# Altium project Control.PrjPcb
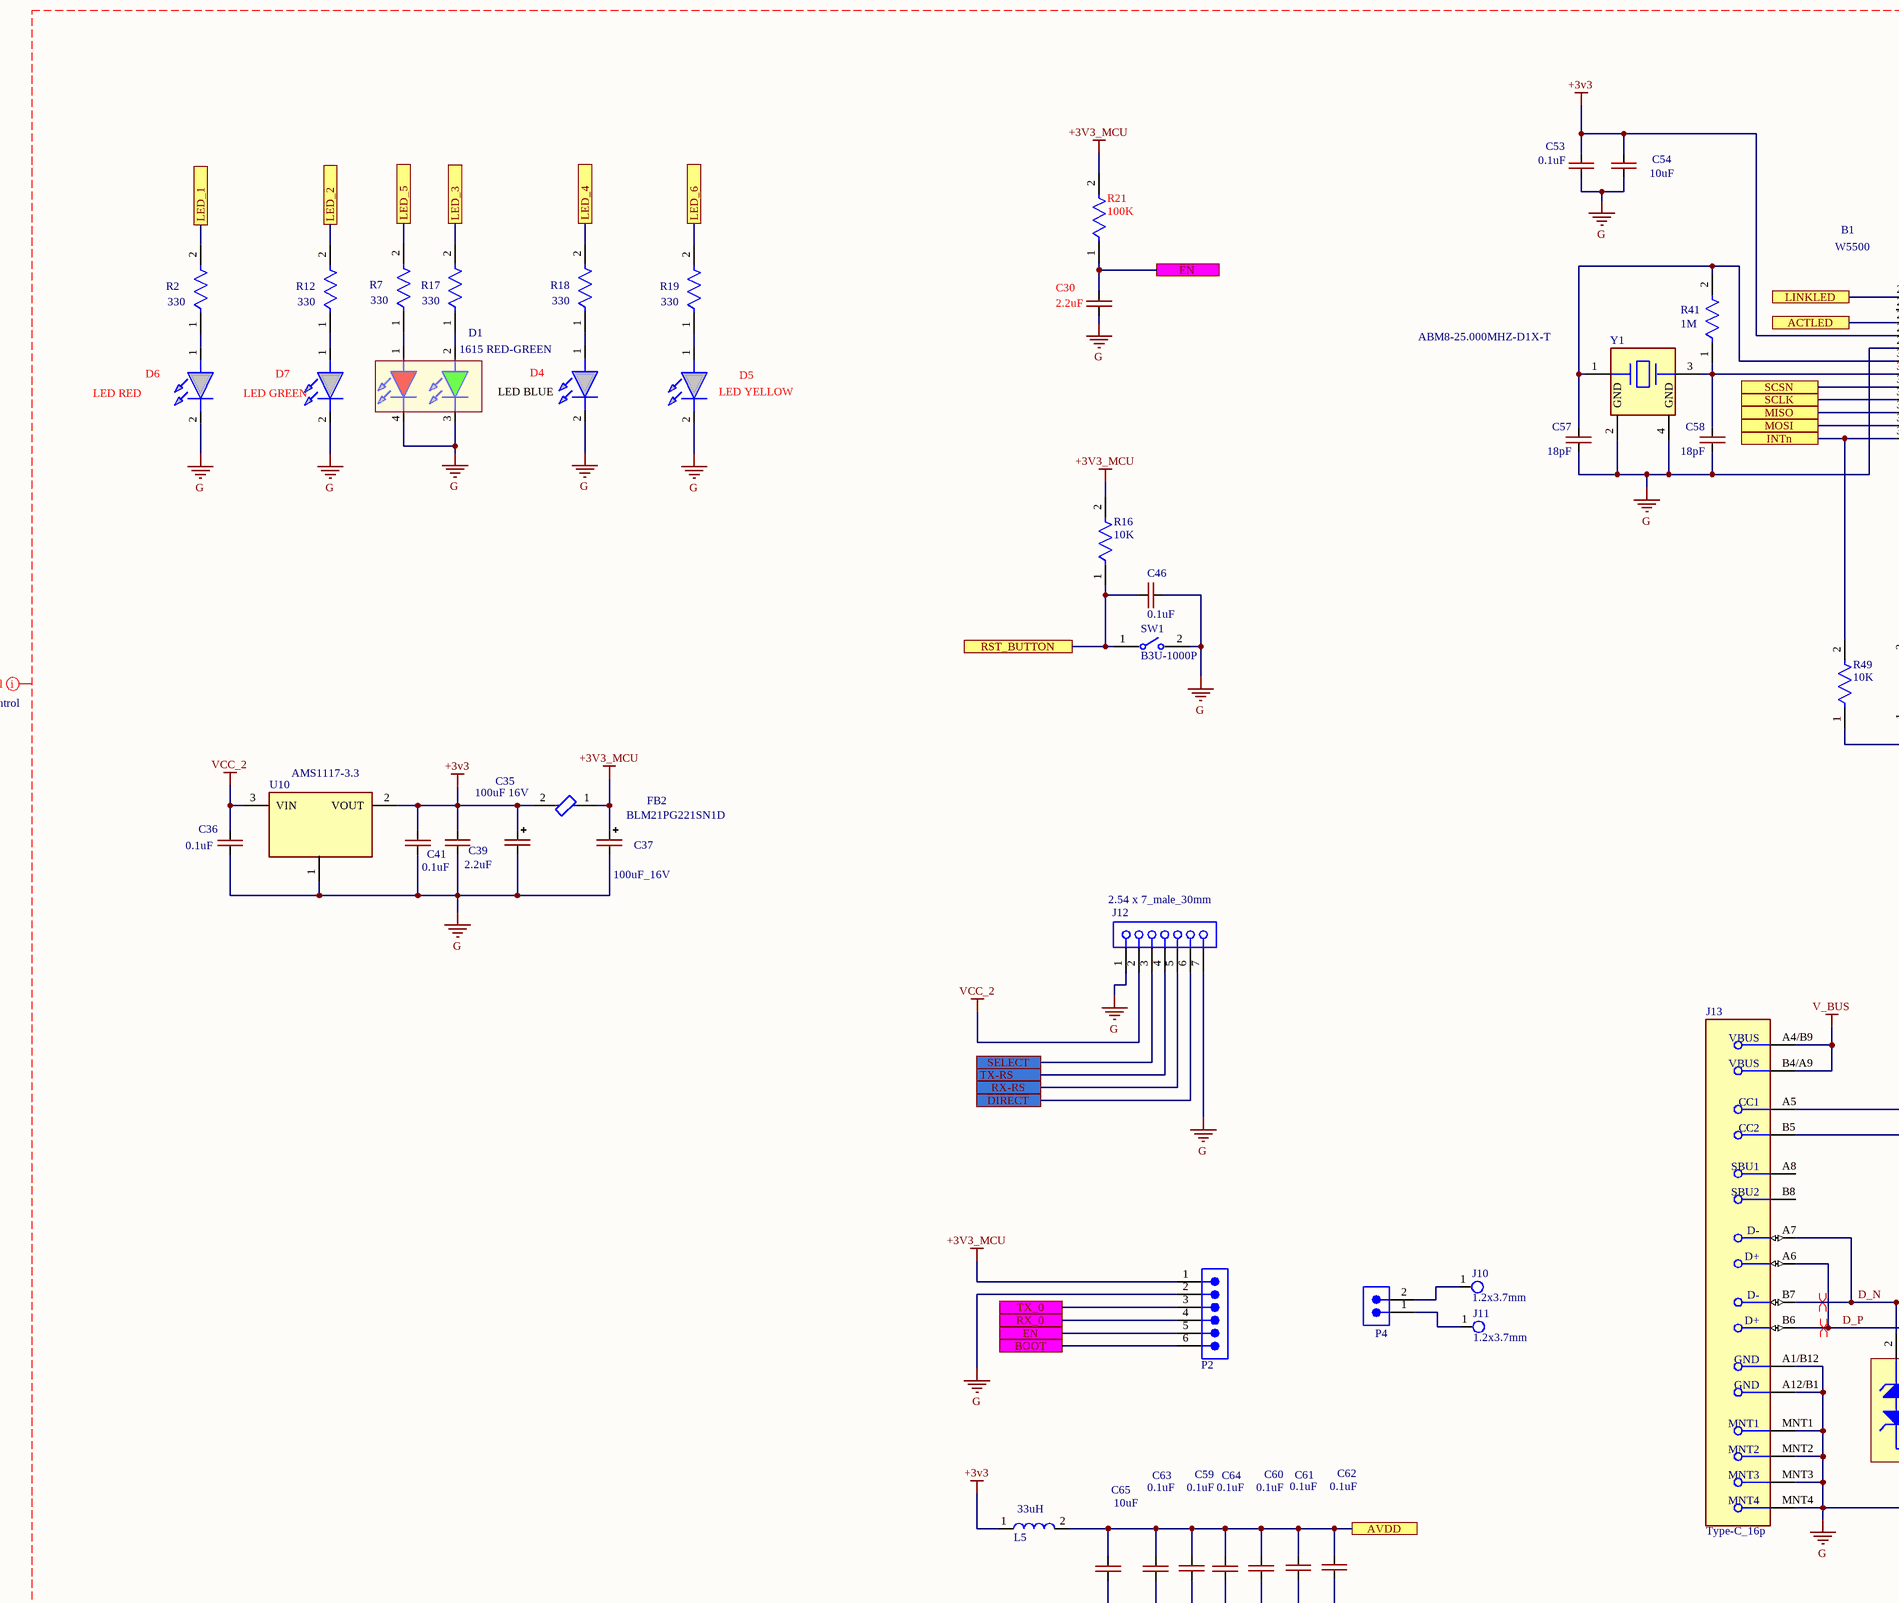
[diagram p0: Control.SchDoc, top left]
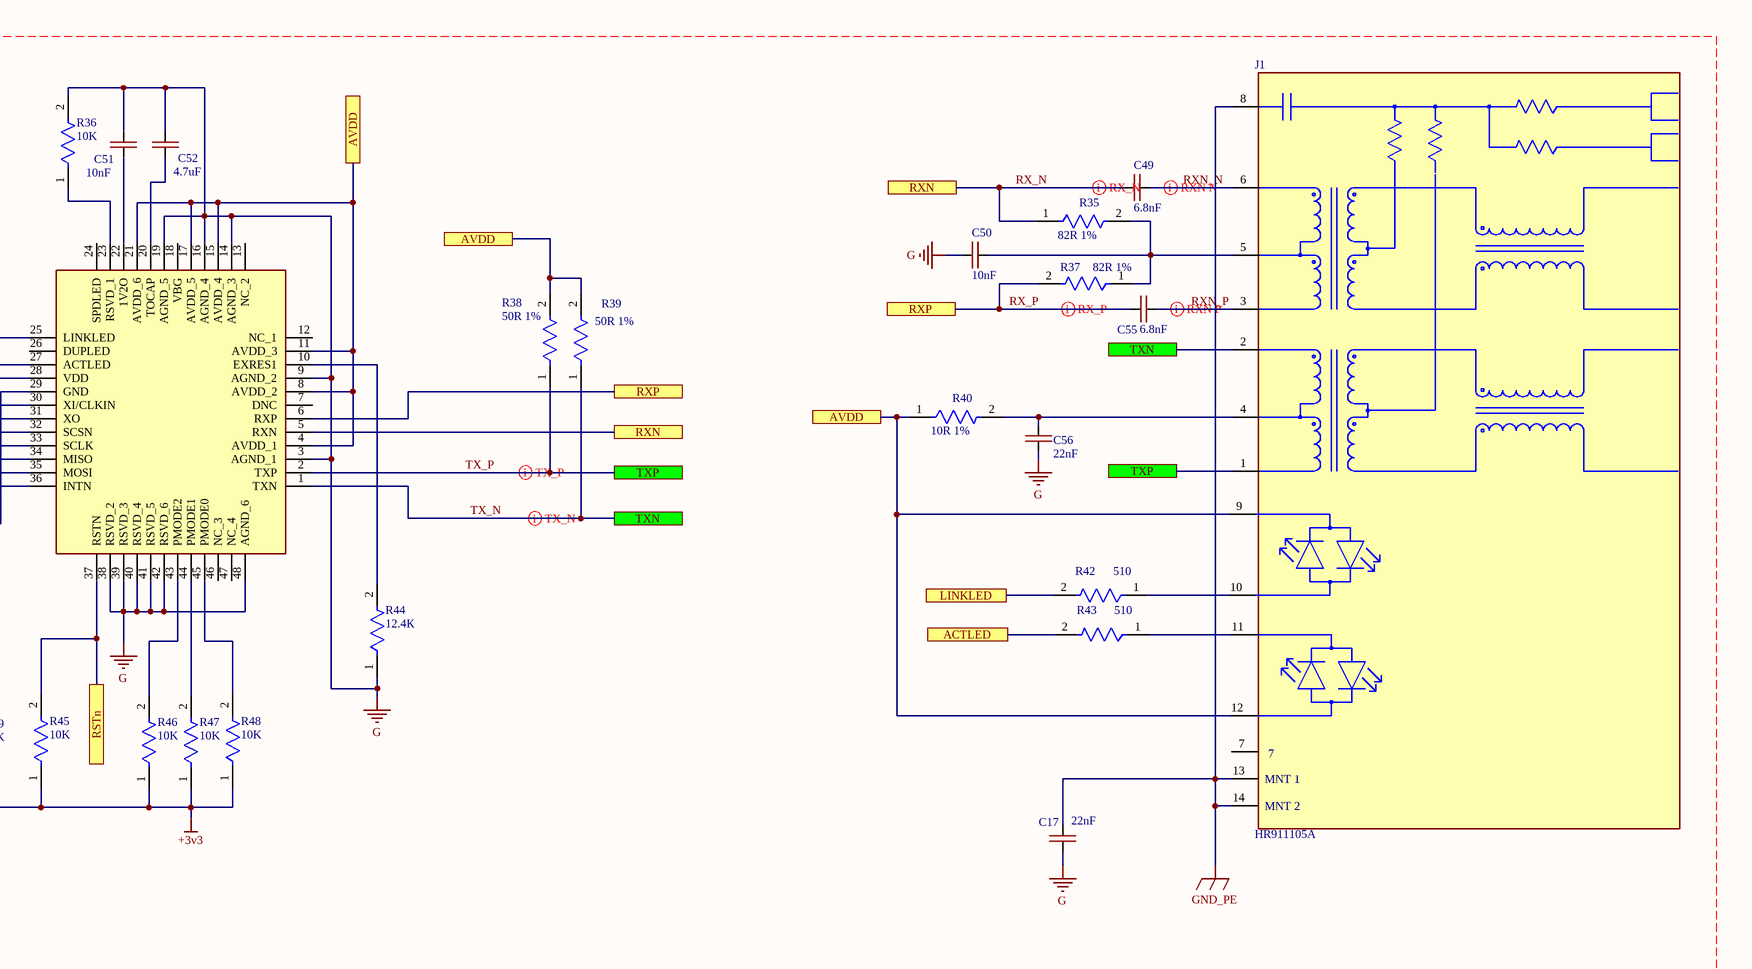
[diagram p1: Control.SchDoc, top right]
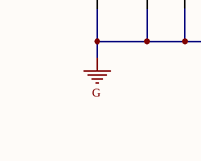
[diagram p2: Control.SchDoc, bottom left]
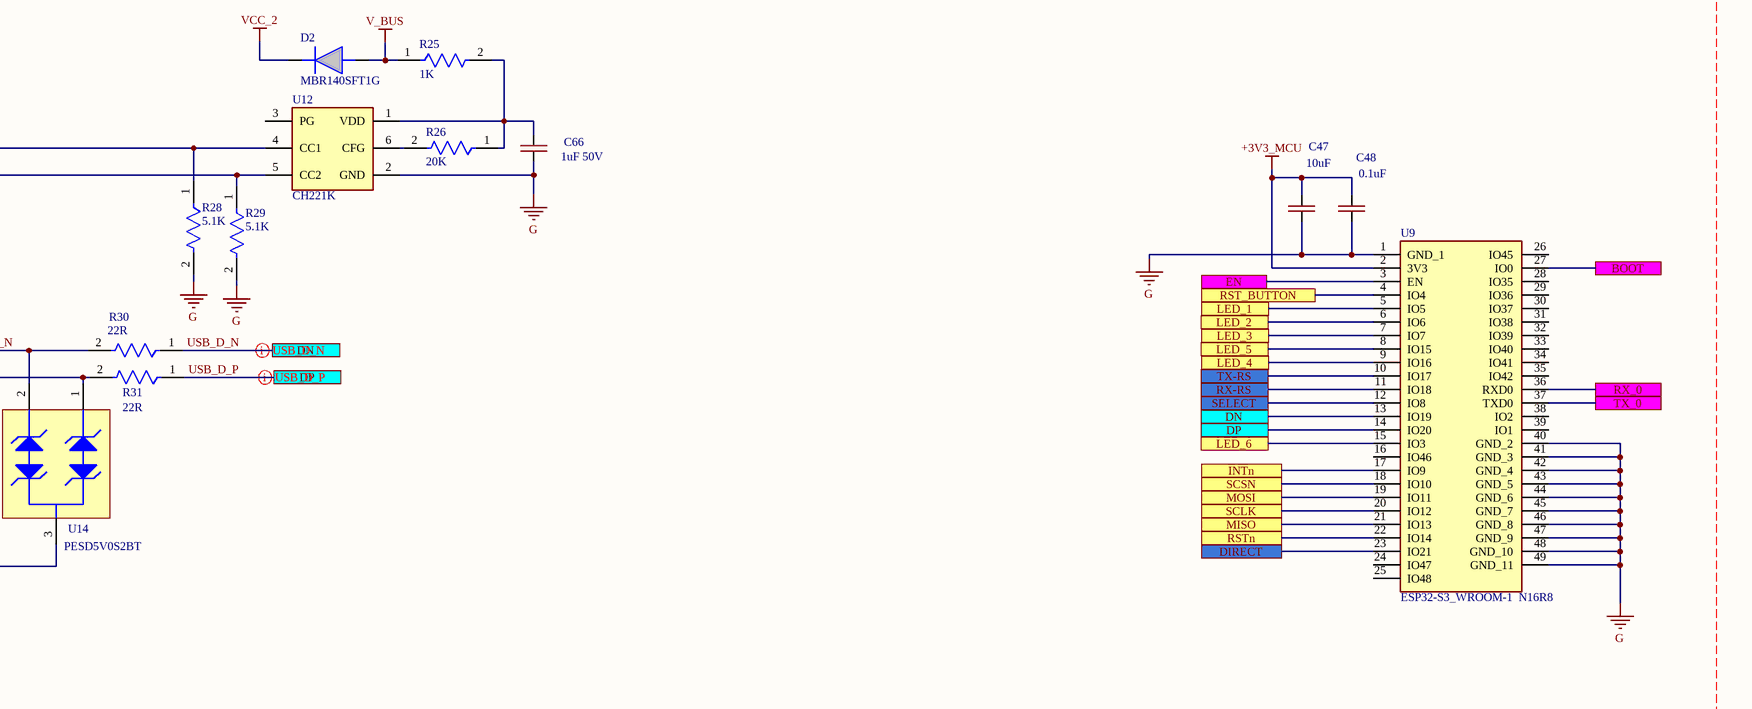
[diagram p3: Control.SchDoc, bottom right]
1 sheet, 79 parts. Net scope: flat (ports and power ports of the same name join across sheets).
Board file: Control.PcbDoc

## Sheet Control.SchDoc
size A1; SheetNumber: 1; SheetTotal: 1; SPICEModelCacheNLVBOJOE: <root> / <DocumentId>NLVBOJOE</DocumentId> / </root>

### Parts
B1  W5500  [QFP50P900X900X160-48N]
C17  22nF  [CAP-0603]
C30  2.2uF  [CAP-0603]
C35  100uF 16V  [CAP-TAN-C]
C36  0.1uF  [CAP-0603]
C37  100uF_16V  [CAP-TAN-C]
C39  2.2uF  [CAP-0603]
C41  0.1uF  [CAP-0603]
C46  0.1uF  [CAP-0603]
C47  10uF  [CAP-0805]
C48  0.1uF  [CAP-0805]
C49  6.8nF  [CAP-0402]
C50  10nF  [CAP-0402]
C51  10nF  [CAP-0603]
C52  4.7uF  [CAP-0603]
C53  0.1uF  [CAP-0603]
C54  10uF  [CAP-0805]
C55  6.8nF  [CAP-0402]
C56  22nF  [CAP-0402]
C57  18pF  [CAP-0402]
C58  18pF  [CAP-0402]
C59  0.1uF  [CAP-0603]
C60  0.1uF  [CAP-0603]
C61  0.1uF  [CAP-0603]
C62  0.1uF  [CAP-0603]
C63  0.1uF  [CAP-0603]
C64  0.1uF  [CAP-0603]
C65  10uF  [CAP-0603]
C66  1uF 50V  [CAP-0805]
D1  1615 RED-GREEN  [LED_Bicolor_1615]
D2  MBR140SFT1G  [SODFL3616X98N]
D4  LED BLUE  [LED_BLUE]
D5  LED YELLOW  [LED_YELLOW]
D6  LED RED  [LED_RED]
D7  LED GREEN  [LED_GREEN]
FB2  BLM21PG221SN1D  [FP-BLM21-0_2-t0_85-e0_5-IPC_A]
J1  HR911105A  [RJ-45]
J10  1.2x3.7mm  [Pad_conn_1.2x3.7mm]
J11  1.2x3.7mm  [Pad_conn_1.2x3.7mm]
J12  2.54 x 7_male_30mm  [2.54_Connector_x7_male_30mm]
J13  Type-C_16p  [Type-C 16p vertical]
L5  33uH  [Coil_4.5x4.5_mm]
P2  61300611121  [61300611121]  (value not drawn)
P4  691305540002  [691305540002]  (value not drawn)
R2  330  [RES-0402]
R7  330  [RES-0402]
R12  330  [RES-0402]
R16  10K  [RES-0402]
R17  330  [RES-0402]
R18  330  [RES-0402]
R19  330  [RES-0402]
R21  100K  [RES-0402]
R25  1K  [RES-0402]
R26  20K  [RES-0402]
R28  5.1K  [RES-0402]
R29  5.1K  [RES-0402]
R30  22R  [RES-0402]
R31  22R  [RES-0402]
R35  82R 1%  [RES-0402]
R36  10K  [RES-0603]
R37  82R 1%  [RES-0402]
R38  50R 1%  [RES-0402]
R39  50R 1%  [RES-0402]
R40  10R 1%  [RES-0402]
R41  1M  [RES-0402]
R42  510  [RES-0402]
R43  510  [RES-0402]
R44  12.4К  [RES-0402]
R45  10K  [RES-0603]
R46  10K  [RES-0603]
R47  10K  [RES-0603]
R48  10K  [RES-0603]
R49  10K  [RES-0603]
SW1  B3U-1000P  [FP-B3U-1000P-B-MFG]
U9  ESP32-S3_WROOM-1  N16R8  [ESP32S3WROOM1N16R8]
U10  AMS1117-3.3  [SOT-89]
U12  CH221K  [SOT-23-6]
U14  PESD5V0S2BT  [PRKT-SOT23-3_V]
Y1  ABM8-25.000MHZ-D1X-T  [FP-ABM8]

### Ports
ACTLED, AVDD, BOOT, DIRECT, DN, DP, EN, INTn, LED_1, LED_2, LED_3, LED_4, LED_5, LED_6, LINKLED, MISO, MOSI, RST_BUTTON, RSTn, RX-RS, RX_0, RXN, RXP, SCLK, SCSN, SELECT, TX-RS, TX_0, TXN, TXP

### Nets
+3v3: B1.28(VDD) C35.1(+) C39.2 C41.2 C53.2 C54.2 FB2.2 L5.1 R45.1 R46.1 R47.1 R48.1 R49.1 U10.2(VOUT)
+3V3_MCU: C37.1(+) C47.2 C48.2 FB2.1 P2.1 R16.2 R21.2 U9.2(3V3)
G: B1.3(AGND_1) B1.9(AGND_2) B1.14(AGND_3) B1.16(AGND_4) B1.19(AGND_5) B1.29(GND) B1.38(RSVD_2) B1.39(RSVD_3) B1.40(RSVD_4) B1.41(RSVD_5) B1.42(RSVD_6) B1.48(AGND_6) C17.1 C30.1 C35.2(-) C36.1 C37.2(-) C39.1 C41.1 C46.1 C47.1 C48.1 C50.1 C51.2 C52.2 C53.1 C54.1 C56.1 C57.1 C58.1 C59.1 C60.1 C61.1 C62.1 C63.1 C64.1 C65.1 C66.1 D1.3(K) D1.4(K) D4.2(K) D5.2(K) D6.2(K) D7.2(K) J12.1 J12.7 J13.A1/B12(GND) J13.A12/B1(GND) J13.MNT1 J13.MNT2 J13.MNT3 J13.MNT4 P2.2 R28.2 R29.2 R36.2 R44.1 SW1.2 U9.1(GND_1) U9.40(GND_2) U9.41(GND_3) U9.42(GND_4) U9.43(GND_5) U9.44(GND_6) U9.45(GND_7) U9.46(GND_8) U9.47(GND_9) U9.48(GND_10) U9.49(GND_11) U10.1(Ground) U12.2(GND) U14.3 Y1.2(GND) Y1.4(GND)
GND_PE: C17.2 J1.8 J1.13(MNT_1) J1.14(MNT_2)
V_BUS: D2.2(A) J13.A4/B9 J13.B4/A9 R25.1
VCC_2: C36.2 D2.1(K) J12.2 U10.3(VIN)
D_N: J13.A7(D-) J13.B7(D-) R30.2 U14.2
D_P: J13.A6(D+) J13.B6(D+) R31.2 U14.1
RX_N: B1.5(RXN) C49.2 R35.1 ; port RXN
RX_P: B1.6(RXP) C55.2 R37.2 ; port RXP
RXN_N: C49.1 J1.6
RXN_P: C55.1 J1.3
TX_N: B1.1(TXN) J1.2 R39.1 ; port TXN
TX_P: B1.2(TXP) J1.1 R38.1 ; port TXP
USB_D_N: R30.1 U9.13(IO19) ; port DN
USB_D_P: R31.1 U9.14(IO20) ; port DP
NetB1_4: B1.4(AVDD_1) B1.8(AVDD_2) B1.11(AVDD_3) B1.15(AVDD_4) B1.17(AVDD_5) B1.21(AVDD_6) C59.2 C60.2 C61.2 C62.2 C63.2 C64.2 C65.2 J1.9(2_ANODE_YELLOW/CATHODE_GREEN) J1.12(2_CATHODE_YELLOW/ANODE_GREEN) L5.2 R38.2 R39.2 R40.1 ; port AVDD
NetB1_10: B1.10(EXRES1) R44.2
NetB1_20: B1.20(TOCAP) C52.1
NetB1_22: B1.22(1V2O) C51.1
NetB1_23: B1.23(RSVD_1) R36.1
NetB1_25: B1.25(LINKLED) R42.2 ; port LINKLED
NetB1_27: B1.27(ACTLED) R43.2 ; port ACTLED
NetB1_30: B1.30(XI/CLKIN) C57.2 R41.2 Y1.1
NetB1_31: B1.31(XO) C58.2 R41.1 Y1.3
NetB1_32: B1.32(SCSN) U9.18(IO10) ; port SCSN
NetB1_33: B1.33(SCLK) U9.20(IO12) ; port SCLK
NetB1_34: B1.34(MISO) U9.21(IO13) ; port MISO
NetB1_35: B1.35(MOSI) U9.19(IO11) ; port MOSI
NetB1_36: B1.36(INTN) R49.2 U9.17(IO9) ; port INTn
NetB1_37: B1.37(RSTN) R45.2 U9.22(IO14) ; port RSTn
NetB1_43: B1.43(PMODE2) R46.2
NetB1_44: B1.44(PMODE1) R47.2
NetB1_45: B1.45(PMODE0) R48.2
NetC30_2: C30.2 P2.5 R21.1 U9.3(EN) ; port EN
NetC46_2: C46.2 R16.1 SW1.1 U9.4(IO4) ; port RST_BUTTON
NetC50_2: C50.2 J1.5 R35.2 R37.1
NetC56_2: C56.2 J1.4 R40.2
NetC66_2: C66.2 R25.2 R26.1 U12.1(VDD)
NetD1_1: D1.1(A) R7.1
NetD1_2: D1.2(A) R17.1
NetD4_1: D4.1(A) R18.1
NetD5_1: D5.1(A) R19.1
NetD6_1: D6.1(A) R2.1
NetD7_1: D7.1(A) R12.1
NetJ1_10: J1.10(2_CATHODE_YELLOW/ANODE_GREEN) R42.1
NetJ1_11: J1.11(2_ANODE_YELLOW/CATHODE_GREEN) R43.1
NetJ10_1: J10.1 P4.2
NetJ11_1: J11.1 P4.1
NetJ12_3: J12.3 U9.12(IO8) ; port SELECT
NetJ12_4: J12.4 U9.10(IO17) ; port TX-RS
NetJ12_5: J12.5 U9.11(IO18) ; port RX-RS
NetJ12_6: J12.6 U9.23(IO21) ; port DIRECT
NetJ13_A5: J13.A5 R28.1 U12.4(CC1)
NetJ13_B5: J13.B5 R29.1 U12.5(CC2)
NetP2_3: P2.3 U9.37(TXD0) ; port TX_0
NetP2_4: P2.4 U9.36(RXD0) ; port RX_0
NetP2_6: P2.6 U9.27(IO0) ; port BOOT
NetR2_2: R2.2 U9.5(IO5) ; port LED_1
NetR7_2: R7.2 U9.8(IO15) ; port LED_5
NetR12_2: R12.2 U9.6(IO6) ; port LED_2
NetR17_2: R17.2 U9.7(IO7) ; port LED_3
NetR18_2: R18.2 U9.9(IO16) ; port LED_4
NetR19_2: R19.2 U9.15(IO3) ; port LED_6
NetR26_2: R26.2 U12.6(CFG)

Not connected (* = marked no-connect by the designer): B1 7(DNC) 12(NC_1) 13(NC_2) 18(VBG) 24(SPDLED) 26(DUPLED) 46(NC_3) 47(NC_4); J1 7; J13 A8 B8; U9 16(IO46) 24(IO47) 25(IO48) 26(IO45) 28(IO35) 29(IO36) 30(IO37) 31(IO38) 32(IO39) 33(IO40) 34(IO41) 35(IO42) 38(IO2) 39(IO1); U12 3(PG)

### Layout directives
differential pair: D_N, D_P, RX_N, RX_P, RXN_N, RXN_P, TX_N, TX_P, USB_D_N, USB_D_P
CompClassName: Control: +3v3, +3V3_MCU, D_N, D_P, G, GND_PE, RX_N, RX_P, RXN_N, RXN_P, TX_N, TX_P, USB_D_N, USB_D_P, V_BUS, VCC_2

### Notes on the sheet
- (in symbol Type-C_16p) VBUS; CC1; CC2; SBU1; SBU2

### Library data of the parts
B1 = W5500: Ethernet ICs 3in1 Enet Controller TCP/IP +MAC+PHY; Manufacturer_Name: Wiznet Technology; Geometry.Height: 1.6mm; Manufacturer_Part_Number: W5500; Mouser Part Number: *; Mouser Price/Stock: *; Arrow Part Number: W5500; Arrow Price/Stock: https://www.arrow.com/en/products/w5500/wiznet?utm_currency=USD&region=nac; Datasheet Link: https://docs.wiznet.io/img/products/w5500/W5500_ds_v110e.pdf
C17 C30 C39 C41 C46-C66 = CAP-NON-POLAR
C35 = CAP-POLAR: 100uF_16V  size-C / Kyocera AVX / TAJC107K016RNJ
C36 = CAP-NON-POLAR: 0.1uF 16V
C37 = CAP_POL_SMD: 100uF_16V  size-C / Kyocera AVX / TAJC107K016RNJ
D1 = LED Bicolor: 1615 bicolor SMD LED 2 colors Red+GREEN / DY-S161506URUGC-T10-4T-03
D2 = MBR140SFT1G: MBR140SFT1G / DIODE SCHOTTKY 40V 1A SOD123L
D4 = LED: XL-2012UBC XINGLIGHT 0805 LED BLUE; Manufacturer_Name: Wurth Elektronik; Manufacturer_Part_Number: 151031YS06000; Geometry.Height: 5.5mm; Mouser Part Number: 710-151031YS06000; Mouser Price/Stock: https://www.mouser.co.uk/ProductDetail/Wurth-Elektronik/151031YS06000?qs=LlUlMxKIyB3xSYYW%252BcuBiQ%3D%3D; Arrow Part Number: *; Arrow Price/Stock: *; Mouser Testing Part Number: *; Mouser Testing Price/Stock: *; Datasheet Link: https://katalog.we-online.de/led/datasheet/151031YS06000.pdf
D5 = LED: XL-2012UYC  XINGLIGHT 0805 LED YELLOW; Manufacturer_Name: Wurth Elektronik; Manufacturer_Part_Number: 151031YS06000; Geometry.Height: 5.5mm; Mouser Part Number: 710-151031YS06000; Mouser Price/Stock: https://www.mouser.co.uk/ProductDetail/Wurth-Elektronik/151031YS06000?qs=LlUlMxKIyB3xSYYW%252BcuBiQ%3D%3D; Arrow Part Number: *; Arrow Price/Stock: *; Mouser Testing Part Number: *; Mouser Testing Price/Stock: *; Datasheet Link: https://katalog.we-online.de/led/datasheet/151031YS06000.pdf
D6 = LED: XL-2012SURC   XINGLIGHT  0805  LED RED; Manufacturer_Name: Wurth Elektronik; Manufacturer_Part_Number: 151031YS06000; Geometry.Height: 5.5mm; Mouser Part Number: 710-151031YS06000; Mouser Price/Stock: https://www.mouser.co.uk/ProductDetail/Wurth-Elektronik/151031YS06000?qs=LlUlMxKIyB3xSYYW%252BcuBiQ%3D%3D; Arrow Part Number: *; Arrow Price/Stock: *; Mouser Testing Part Number: *; Mouser Testing Price/Stock: *; Datasheet Link: https://katalog.we-online.de/led/datasheet/151031YS06000.pdf
D7 = LED: XL-2012SYGC-06  XINGLIGHT  0805  LED GREEN; Manufacturer_Name: Wurth Elektronik; Manufacturer_Part_Number: 151031YS06000; Geometry.Height: 5.5mm; Mouser Part Number: 710-151031YS06000; Mouser Price/Stock: https://www.mouser.co.uk/ProductDetail/Wurth-Elektronik/151031YS06000?qs=LlUlMxKIyB3xSYYW%252BcuBiQ%3D%3D; Arrow Part Number: *; Arrow Price/Stock: *; Mouser Testing Part Number: *; Mouser Testing Price/Stock: *; Datasheet Link: https://katalog.we-online.de/led/datasheet/151031YS06000.pdf
FB2 = BLM21PG221SN1D: Chip Ferrite Bead, 0805, 220Ω @ 100MHz, 0.045Ω, 25%, 2A
J1 = HRK1-1B72F09
J10 J11 = Klema_15_A
J12 = 2.54_Connector_x7_male_25mm: 2.54_Connector_x7_male_30mm / Pitch Single Row Male Header Needle Height Long 30mm
J13 = Type-C_16p: Type-C_16p  TYPE-C16P female socket vertical plug-in patch 8.8 mm / TYPE-C-31-D-16 / https://www.aliexpress.com/item/1005012731556882.html?spm=a2g0o.cart.0.0.a5d038da7FoSd6&mp=1&pdp_npi=6%40dis%21UAH%21UAH+257.01%21UAH+231.29%21%21UAH+223.44%21%21%21%402103842a17955063158303339e1049%2112000059158355455%21ct%21UA%214339914066%21%211%210%21
L5 = Coil
P2 = 61300611121: WR-PHD Pin Header, THT, Vertical, pitch 2.54mm, 1 Row, 6P; Manufacturer: Wurth Elektronik; Contact Resistance: 20mΩ; Rated Current: 3A; Working Voltage: 250V; Withstanding Voltage: 500V; ComponentLink1Description: Website Link; ComponentLink1URL: https://www.we-online.com/redexpert/article/61300611121?ad; ComponentLink2Description: Datasheet Link; ComponentLink2URL: https://www.we-online.com/redexpert/spec/61300611121?ad; Manufacturer Part Number: 61300611121; Category: Board-to-Board Connectors; Match Code: WR-PHD; Mount: Through Hole; Operating Temperature Max: 105°C; Operating Temperature Min: -40°C; Packaging: Bag; Gender: Pin Header; Number of Pins: 6; Number of Rows: 1; Orientation: Vertical; Pitch: 2.54mm
P4 = 691305540002: WR-TBL Series 3055 PCB Header Horizontal Entry with Plastic Latches, THT, pitch 5.08mm, 02p; Manufacturer: Wurth Elektronik; Modularity: No; Rated Current: 16A; Working Voltage: 300V (AC); Manufacturer Part Number: 691305540002; Product Series: WR-TBL; ComponentLink1Description: Website Link; ComponentLink1URL: https://www.we-online.com; ComponentLink2Description: Datasheet Link; ComponentLink2URL: https://www.we-online.com/components/products/datasheet/691305540002; Mount: Through Hole; Operating Temperature Min: -40degC; Operating Temperature Max: 105degC; Packaging: Box; Application: Pluggable; Number of Pins: 2; Number of Rows: 1; Orientation: Horizontal; Lead Pitch: 5.08mm
R2 R7 R12 R16-R19 R21 R25 R26 R28-R31 R35-R43 R45-R49 = RES-CONST
R44 = RES-CONST: 12.4К  1%
U9 = ESP32-S3_WROOM-1 N16R8
U10 = AMS1117
U12 = CH221K: WCH CH221K / https://www.lcsc.com/product-detail/C5125736.html?s_z=n_q_x_CH221K&spm=wm.ssy.em.0.tz&lcsc_vid=T1ILBVxSEgBWUlIFElIIVl1eEgJYAVZUQVBaAlBUQVExVlNfQlRfXlNXQ1JfUTsOAxUeFF5JWBYZEEoKFBINSQcJGk4NBhADEA4cHktXRlVeSQwSGg0%3D
U14 = CMP-2000-07553-1: TVS Array - Low capacitance bidirectional double ESD protection diode / https://www.lcsc.com/product-detail/C49338.html?s_z=n_q_PESD5V0S2BT&spm=wm.fly.bg.0.xh&lcsc_vid=T1ILBVxSEgBWUlIFElIIVl1eEgJYAVZUQVBaAlBUQVExVlNfQldfUFRWQVRbVDsOAxUeFF5JWBYZEEoKFBINSQcJGk4NBhADEA4cHktRR1NADxALGw%3D%3D; Manufacturer: Protek Devices; Min Breakdown Voltage: 7.5V; Capacitance: 75pF; Current: 20uA; Power Dissipation: 600W; Working Voltage: 7V; Voltage: 12V; Case\/Package: SOT-23; Clamping Voltage: 17V; Element Configuration: Dual; Mounting Technology: SurfaceMount; Direction: Bidirectional; RoHSCompliant: True; Radiation Hardening: No; Depth: 1.4mm; Lead Free: LeadFree; Package Description: 3-Pin Small Outline Transistor, Body 2.92 x 1.3 mm, Pitch 0.94 mm; Max Operating Temperature: 150degC; Length: 3.04mm; Manufacturer URL: http://www.protekdevices.com/; Min Operating Temperature: -55degC; Leakage Current: 20uA; Datasheet URL: www.protekdevices.com/xyz/documents/datasheets/psm712.pdf; Packaging: TapeandReel; Datasheet Version: 10/2013; Package Reference: SOT23-3; Number of Pins: 3
Y1 = ABM8-25.000MHZ: Crystal 25MHz ±10ppm 18pF SMD-4 3.2mm x 2.5mm